# Altium schematic sheet FG23_diff_PA_match_SCH_Title.SchDoc
size 420 x 297 mm
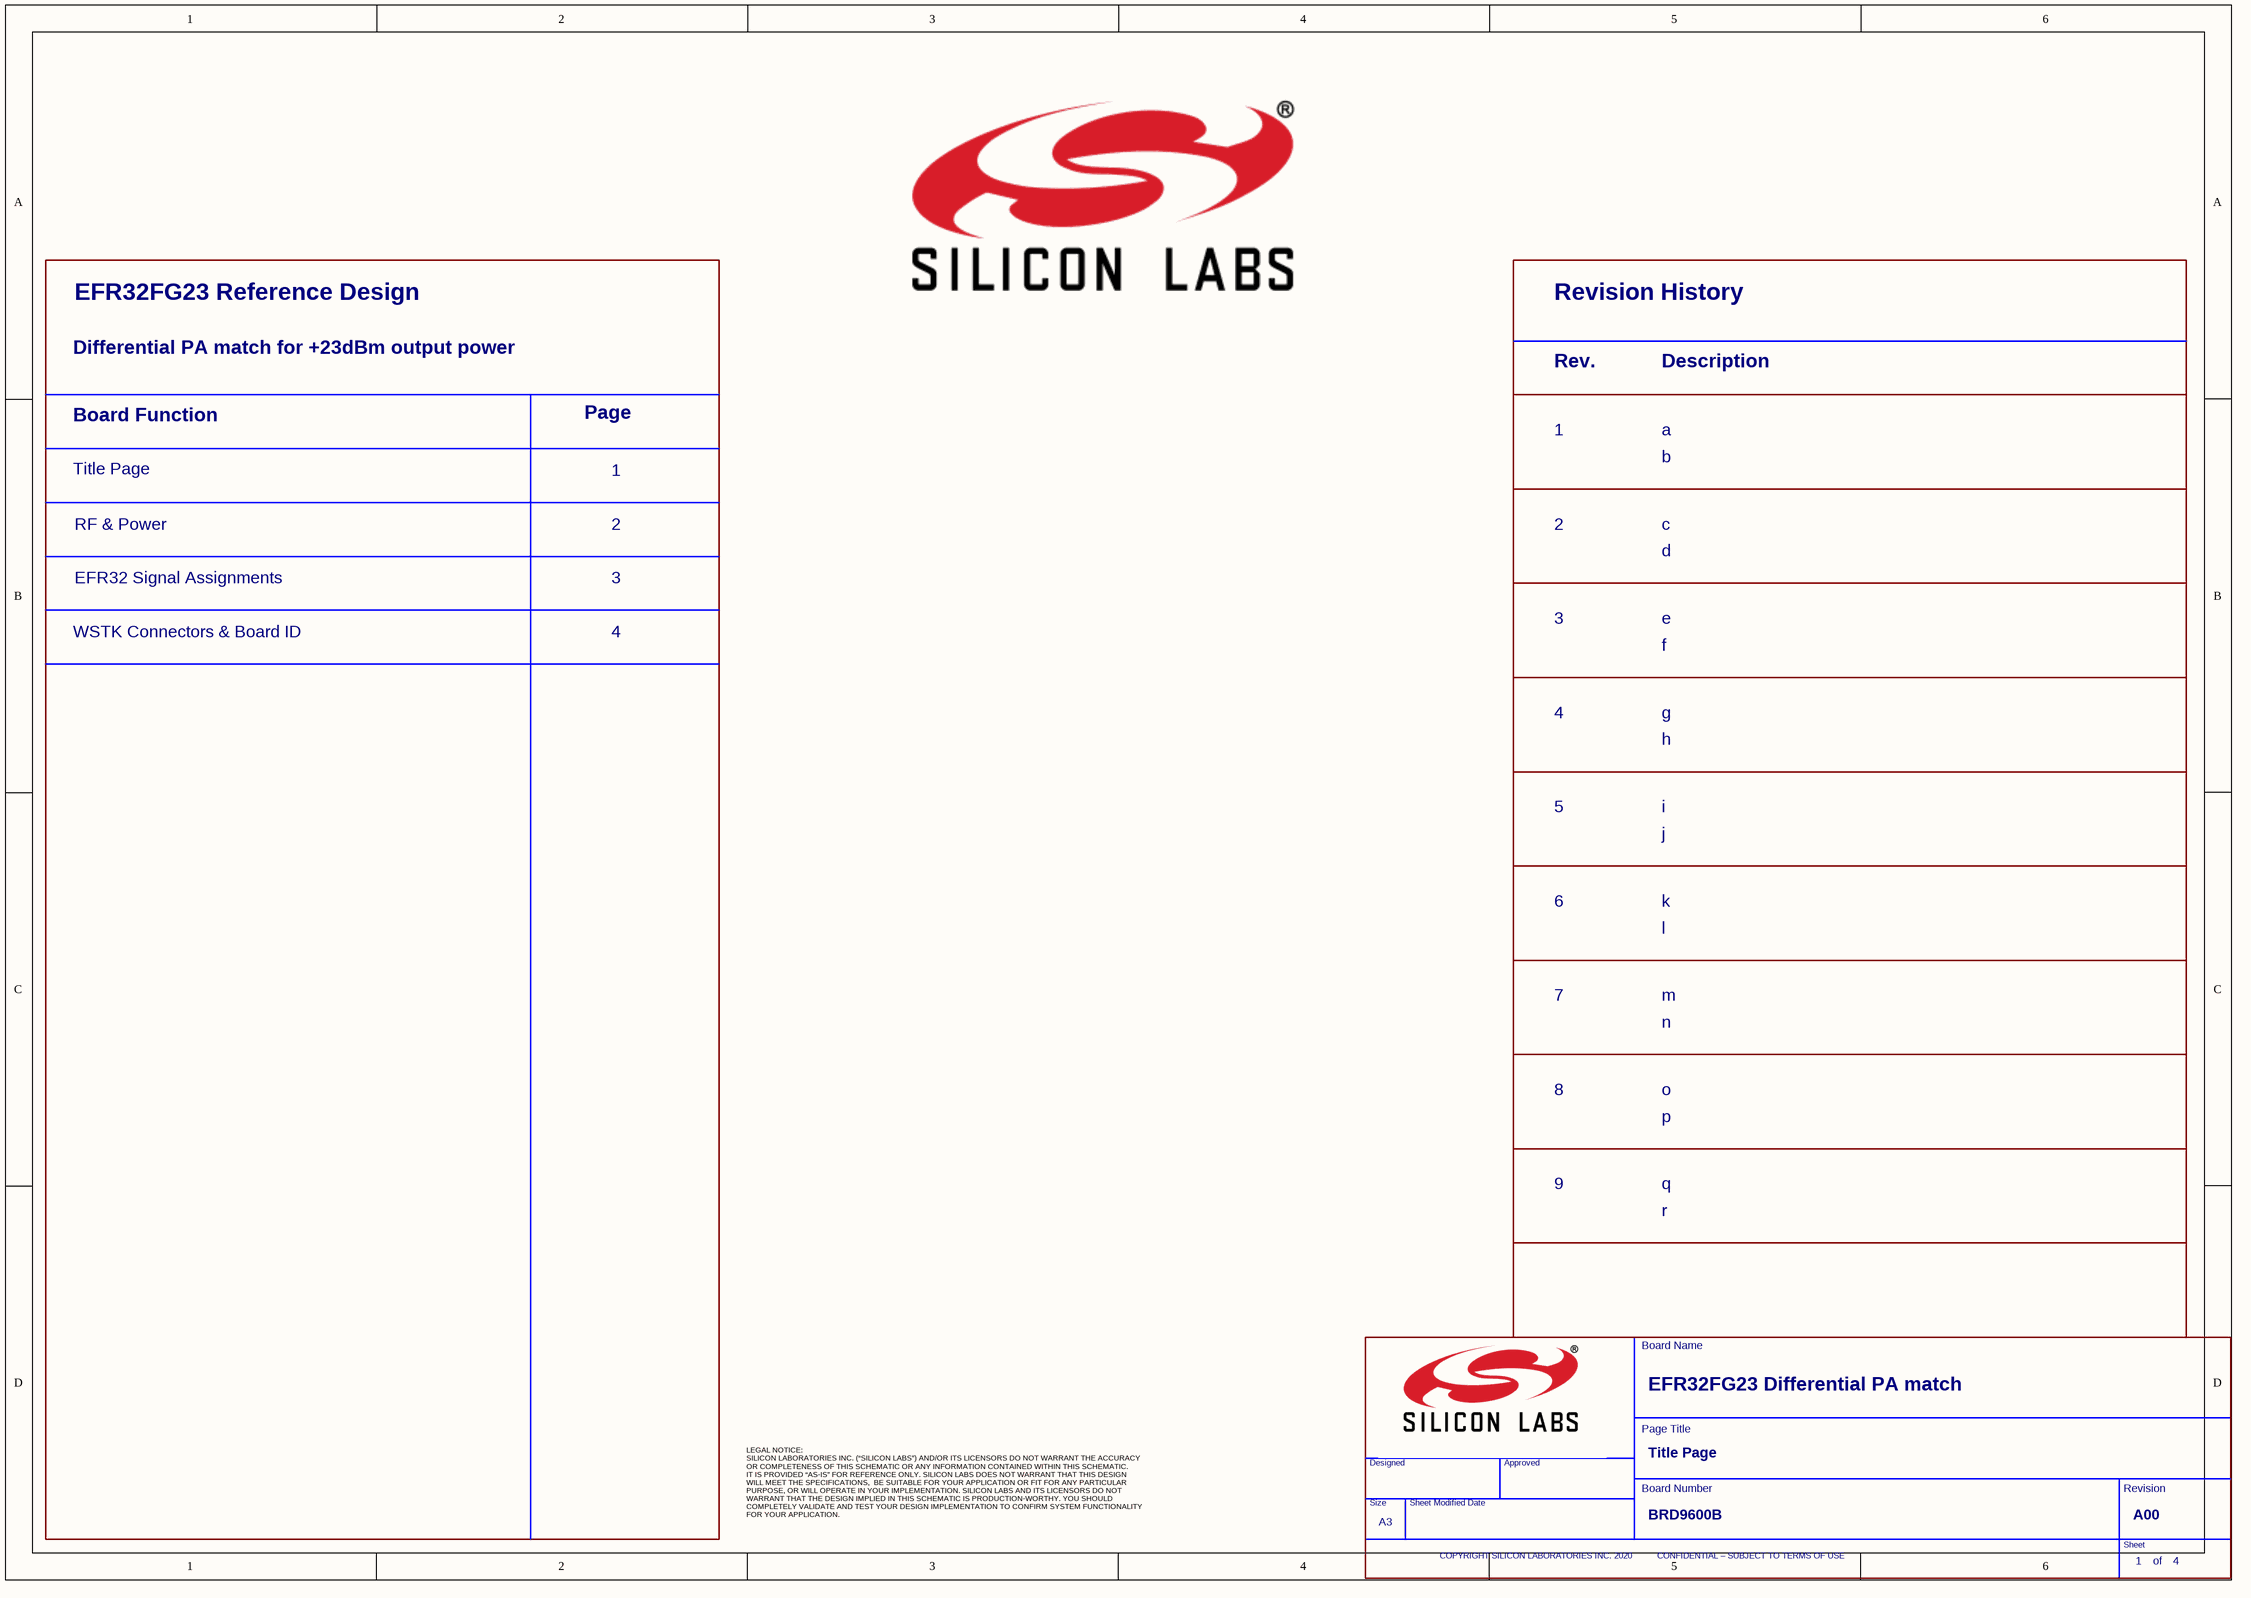
[diagram p0: FG23_diff_PA_match_SCH_Title.SchDoc]

## Parts
(Parts that share a designator on the sheet are numbered #1, #2 ... from top to bottom, then left to right.)
*#1  Header A: EFR32FG23 Reference Design  Header B: Differential PA match for +23dBm output power  (hidden comment: Toc_Header)  (graphical)
*#2  Dscr4B: h  Dscr5B: j  Dscr4A: g  Dscr6B: l  Dscr5A: i  Dscr7B: n  Dscr6A: k  Dscr8B: p  Dscr7A: m  Dscr9B: r  Dscr8A: o  Dscr9A: q  Dscr1B: b  Dscr2B: d  Dscr1A: a  Dscr3B: f  Dscr2A: c  Dscr3A: e  Rev9: 9  Rev8: 8  Rev7: 7  Rev6: 6  Rev5: 5  Rev4: 4  Rev3: 3  Rev2: 2  Rev1: 1  (hidden comment: Rev_History)  (graphical)
*#3  Doc: BRD9600B  RevCode: A00  Page Title: Title Page  Page Size: A3  Page Number: 1  Page Count: 4  Title: EFR32FG23 Differential PA match  (hidden comment: TitleBlock_SiliconLabs_A3)  (graphical)

## Notes on the sheet
- Board Function
- Page
- Title Page
- RF & Power
- 1
- 2
- EFR32 Signal Assignments
- 3
- WSTK Connectors & Board ID
- 4
- LEGAL NOTICE:
  SILICON LABORATORIES INC. (“SILICON LABS”) AND/OR ITS LICENSORS DO NOT WARRANT THE ACCURACY
  OR COMPLETENESS OF THIS SCHEMATIC OR ANY INFORMATION CONTAINED WITHIN THIS SCHEMATIC.
  IT IS PROVIDED “AS-IS” FOR REFERENCE ONLY. SILICON LABS DOES NOT WARRANT THAT THIS DESIGN
  WILL MEET THE SPECIFICATIONS,  BE SUITABLE FOR YOUR APPLICATION OR FIT FOR ANY PARTICULAR
  PURPOSE, OR WILL OPERATE IN YOUR IMPLEMENTATION. SILICON LABS AND ITS LICENSORS DO NOT
  WARRANT THAT THE DESIGN IMPLIED IN THIS SCHEMATIC IS PRODUCTION-WORTHY. YOU SHOULD
  COMPLETELY VALIDATE AND TEST YOUR DESIGN IMPLEMENTATION TO CONFIRM SYSTEM FUNCTIONALITY
  FOR YOUR APPLICATION.
- (in symbol Rev_History) Revision History; Rev.; Description
- (in symbol TitleBlock_SiliconLabs_A3) Board Name; Page Title; Designed; Approved; Board Number; Revision; Size; Sheet Modified Date; Sheet; COPYRIGHT SILICON LABORATORIES INC. 2020          CONFIDENTIAL – SUBJECT TO TERMS OF USE; of

## Library data of the parts
*#2 = Rev_History: RevCode: PA00*
*#3 = TitleBlock_SiliconLabs_A3: OrgName: Silicon Labs